# Altium schematic sheet esp32p10displaySheet1.SchDoc
size 381 x 241 mm; SheetNumber: 1; SheetTotal: 4
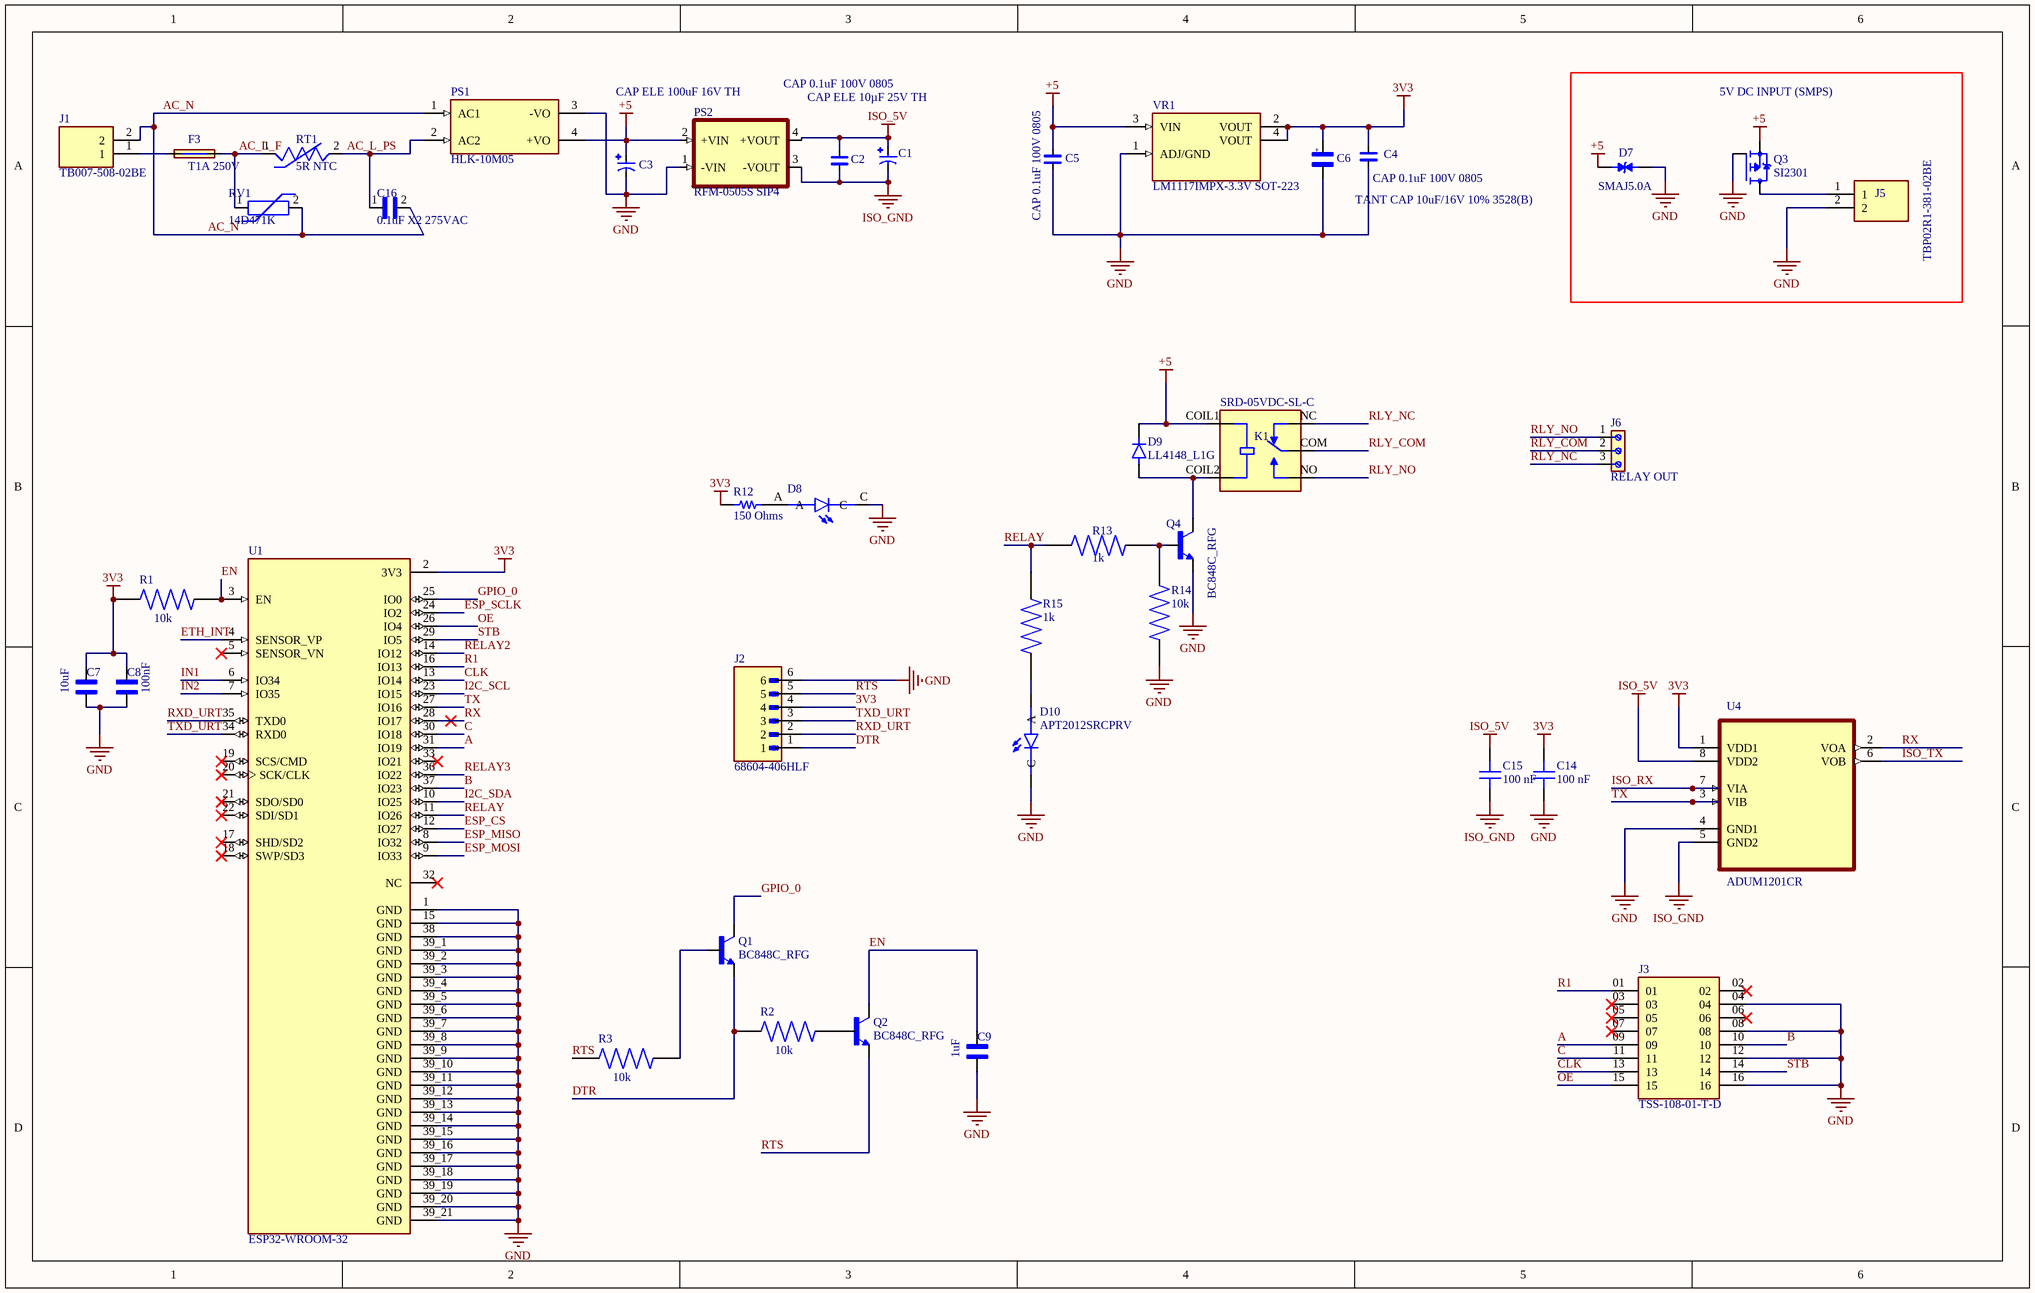
[diagram p0: esp32p10displaySheet1.SchDoc]

## Parts
C1  CAP ELE 10µF 25V TH  [CAP ELE 10µF 25V TH]
C2  CAP 0.1uF 100V 0805  [CAP CER 0.1uF/50V 5%]
C3  CAP ELE 100uF 16V TH  [CAP ELE 10µF 25V TH]
C4  CAP 0.1uF 100V 0805  [CAP CER 0.1uF/50V 5%]
C5  CAP 0.1uF 100V 0805  [CAP CER 0.1uF/50V 5%]
C6  TANT CAP 10uF/16V 10% 3528(B)  [TANT CAP 3528(B)]
C7  10uF  [CAPC3216X175N]
C8  100nF  [CAPC3216X175N]
C9  1uF  [CAPC3216X175N]
C14  Capacitance: 100 nF  [CAP 0805_2012]  (hidden comment: 100nF)
C15  Capacitance: 100 nF  [CAP 0805_2012]  (hidden comment: 100nF)
C16  0.1uF X2 275VAC  [CAPRR1500W60L1750T500H1200]
D7  SMAJ5.0A  [DIOM4325X250N]
D8  597-3305-607F  [LEDC2012X70N]  (value not drawn)
D9  LL4148_L1G  [DIOMELF3515N]
D10  APT2012SRCPRV  [LEDC2012X75N]
F3  T1A 250V  [TR5]
J1  TB007-508-02BE  [CUI_TB007-508-02BE]
J2  68604-406HLF  [AMPHENOL_68604-406HLF]
J3  TSS-108-01-T-D  [SAMTEC_TSS-108-01-T-D]
J5  TBP02R1-381-02BE  [CUI_TBP02R138102BE]
J6  RELAY OUT  [691236510003]
K1  SRD-05VDC-SL-C  [RELAY_SRD-03VDC-SL-C]
PS1  HLK-10M05  [CONV_HLK-10M05]
PS2  RFM-0505S SIP4  [RFM-0505S]
Q1  BC848C_RFG  [SOT95P237X112-3N]
Q2  BC848C_RFG  [SOT95P237X112-3N]
Q3  SI2301  [DESTO_SOT23]
Q4  BC848C_RFG  [SOT95P237X112-3N]
R1  10k  [RES_ERA6VRB1002V]
R2  10k  [RES_ERA6VRB1002V]
R3  10k  [RES_ERA6VRB1002V]
R12  150 Ohms  [RES 0805_2012]
R13  1k  [RES_ERA6VRB1002V]
R14  10k  [RES_ERA6VRB1002V]
R15  1k  [RES_ERA6VRB1002V]
RT1  5R NTC  [THRMRB500W60L1150T500H1600]
RV1  14D471K  [MOV14D471K]
U1  ESP32-WROOM-32  [MODULE_ESP32-WROOM-32]
U4  ADUM1201CR  [SOIC127P600X175-8N]
VR1  LM1117IMPX-3.3V SOT-223  [LM1117IMPX-3.3V SOT-223]

## Blocks framed on the sheet
5V DC INPUT (SMPS): D7 J5 Q3

## Nets
3V3: C4.2 C6.1 C7.1 C8.1 C14.2 J2.4 R1.1 R12.1 U1.2(3V3) U4.1(VDD1) VR1.2(VOUT) VR1.4(VOUT)
+5: C3.P C5.2 D7.C D9.C(K) K1.COIL1 PS1.4(+VO) PS2.2(+VIN) Q3.2(S) VR1.3(VIN)
GND: C3.N C4.1 C5.1 C6.2 C7.2 C8.2 C9.2 C14.1 D7.A D8.C D10.C J2.6 J3.04 J3.08 J3.12 J3.16 J5.2 PS1.3(-VO) PS2.1(-VIN) Q3.1(G) Q4.2(E) R14.1 U1.1(GND) U1.15(GND) U1.38(GND) U1.39_1(GND) U1.39_2(GND) U1.39_3(GND) U1.39_4(GND) U1.39_5(GND) U1.39_6(GND) U1.39_7(GND) U1.39_8(GND) U1.39_9(GND) U1.39_10(GND) U1.39_11(GND) U1.39_12(GND) U1.39_13(GND) U1.39_14(GND) U1.39_15(GND) U1.39_16(GND) U1.39_17(GND) U1.39_18(GND) U1.39_19(GND) U1.39_20(GND) U1.39_21(GND) U4.4(GND1) VR1.1(ADJ/GND)
ISO_5V: C1.P C2.2 C15.2 PS2.4(+VOUT) U4.8(VDD2)
ISO_GND: C1.N C2.1 C15.1 PS2.3(-VOUT) U4.5(GND2)
A: J3.09 U1.31(IO19)
AC_L_F: F3.2 RT1.1 RV1.1
AC_L_PS: C16.1 PS1.2(AC2) RT1.2
AC_N: C16.2 J1.2 PS1.1(AC1) RV1.2
B: J3.10 U1.37(IO23)
C: J3.11 U1.30(IO18)
CLK: J3.13 U1.13(IO14)
DTR: J2.1 Q1.2(E) R2.1
EN: C9.1 Q2.3(C) R1.2 U1.3(EN)
ESP_CS: U1.12(IO27)
ESP_MISO: U1.8(IO32)
ESP_MOSI: U1.9(IO33)
ESP_SCLK: U1.24(IO2)
ETH_INT: U1.4(SENSOR_VP)
GPIO_0: Q1.3(C) U1.25(IO0)
I2C_SCL: U1.23(IO15)
I2C_SDA: U1.10(IO25)
IN1: U1.6(IO34)
IN2: U1.7(IO35)
ISO_RX: U4.7(VIA)
ISO_TX: U4.6(VOB)
OE: J3.15 U1.26(IO4)
R1: J3.01 U1.16(IO13)
RELAY: R13.1 R15.2 U1.11(IO26)
RELAY2: U1.14(IO12)
RELAY3: U1.36(IO22)
RLY_COM: J6.2 K1.COM
RLY_NC: J6.3 K1.NC
RLY_NO: J6.1 K1.NO
RTS: J2.5 Q2.2(E) R3.1
RX: U1.28(IO17) U4.2(VOA)
RXD_URT: J2.2 U1.35(TXD0)
STB: J3.14 U1.29(IO5)
TX: U1.27(IO16) U4.3(VIB)
TXD_URT: J2.3 U1.34(RXD0)
NetD8_A: D8.A R12.2
NetD9_A: D9.A K1.COIL2 Q4.3(C)
NetD10_A: D10.A R15.1
NetF3_1: F3.1 J1.1
NetJ5_1: J5.1 Q3.3(D)
NetQ1_1: Q1.1(B) R3.2
NetQ2_1: Q2.1(B) R2.2
NetQ4_1: Q4.1(B) R13.2 R14.2

Not connected (* = marked no-connect by the designer): J3 02* 03* 05* 06* 07*; U1 5(SENSOR_VN)* 17(SHD/SD2)* 18(SWP/SD3)* 19(SCS/CMD)* 20(SCK/CLK)* 21(SDO/SD0)* 22(SDI/SD1)* 32(NC)* 33(IO21)*

## Notes on the sheet
- (in symbol TANT CAP 10uF/16V 5% 3528(B)) +

## Library data of the parts
C1 = CAP ELE 10µF 25V TH: 10µF 25V Aluminum Electrolytic Capacitors Radial Lead Type TH, Dia-5mm, Pitch-2mm ECEA1EN100UI; MF: Panasonic; Package: RADIAL-2 Panasonic; Purchase-URL: https://pricing.snapeda.com/search/part/ECEA1EN100UI/?ref=eda; Value: *; Digi-Key_Part_Number: ECE-A1EN100UI-ND; SnapEDA_Link: https://www.snapeda.com/parts/ECEA1EN100UI/Panasonic/view-part/5788532/?ref=snap; MP: ECEA1EN100UI; Check_prices: https://www.snapeda.com/parts/ECEA1EN100UI/Panasonic/view-part/5788532/?ref=eda
C2 = CAP CER 0.1uF/50V 5%: CAP CER 0.1uF/100V  Ceramic Capacitor X7R 0805 (2012 Metric); MF: Samsung; MP: CL21B104KCFNNNE; Purchase-URL: https://pricing.snapeda.com/search?q=CL21B104KCFNNNE&ref=eda; Package: 0805 Samsung; Check_prices: https://www.snapeda.com/parts/CL21B104KCFNNNE/Samsung+Electro-Mechanics/view-part/?ref=eda; Value: *; SnapEDA_Link: https://www.snapeda.com/parts/CL21B104KCFNNNE/Samsung+Electro-Mechanics/view-part/?ref=snap; Digi-Key_Part_Number: 1276-6840-2-ND
C3 = CAP ELE 10µF 25V TH: 100uF 16V Aluminum Electrolytic Capacitor Radial TH, Dia-5mm x 11mm (Panasonic M series); MP: ECA-1CM101; Package: RADIAL-2 Panasonic; MF: Panasonic; Value: *
C4 C5 = CAP CER 0.1uF/50V 5%: CAP CER 0.1uF/100V  Ceramic Capacitor X7R 0805 (2012 Metric) SMT; MF: Samsung; MP: CL21B104KCFNNNE; Purchase-URL: https://pricing.snapeda.com/search?q=CL21B104KCFNNNE&ref=eda; Package: 0805 Samsung; Check_prices: https://www.snapeda.com/parts/CL21B104KCFNNNE/Samsung+Electro-Mechanics/view-part/?ref=eda; Value: *; SnapEDA_Link: https://www.snapeda.com/parts/CL21B104KCFNNNE/Samsung+Electro-Mechanics/view-part/?ref=snap; Digi-Key_Part_Number: 1276-6840-2-ND
C6 = TANT CAP 10uF/16V 5% 3528(B): 10 µF Molded Tantalum Capacitor 16V 10% 1411 (3528 Metric), 1210 TAJB106K016RNJ; MF: AVX; SnapEDA_Link: https://www.snapeda.com/parts/TAJB106K016RNJ/AVX/view-part/?ref=snap; Package: 1210 AVX; Value: *; MP: TAJB106K016RNJ; Check_prices: https://www.snapeda.com/parts/TAJB106K016RNJ/AVX/view-part/?ref=eda
C7 = C1206C102KGRACAUTO: 10 µF ±10% 16V Ceramic Capacitor X7R 1206 (3216 Metric); MF: Murata; MP: GRM31CR71C106KAC7L; SnapEDA_Link: https://www.snapeda.com/search?q=GRM31CR71C106KAC7L&ref=snap; Package: 3216 KEMET; Value: *; Check_prices: https://www.snapeda.com/search?q=GRM31CR71C106KAC7L&ref=eda
C8 = C1206C102KGRACAUTO: 0.1 µF ±10% 50V Ceramic Capacitor X7R 1206 (3216 Metric); MF: KEMET; MP: C1206C104K5RACTU; SnapEDA_Link: https://www.snapeda.com/search?q=C1206C104K5RACTU&ref=snap; Package: 3216 KEMET; Value: *; Check_prices: https://www.snapeda.com/search?q=C1206C104K5RACTU&ref=eda
C9 = C1206C102KGRACAUTO: 1 µF ±10% 50V Ceramic Capacitor X7R 1206 (3216 Metric); MF: KEMET; MP: C1206C105K5RACTU; SnapEDA_Link: https://www.snapeda.com/search?q=C1206C105K5RACTU&ref=snap; Package: 3216 KEMET; Value: *; Check_prices: https://www.snapeda.com/search?q=C1206C105K5RACTU&ref=eda
C14 C15 = C0805C102F3HACAUTO: CAP CER 0805 0.1UF 100V X7R; Part Number: CL21B104KCFNNNE; manufacturer: Samsung Electro-Mechanics; Tolerance: ±10%; Applications: General Purpose; componentlink1description: Datasheet; componentlink1url: https://pricing.snapeda.com/search?q=CL21B104KCFNNNE&ref=eda; componentlink2description: DigiKey Link; componentlink2url: https://www.digikey.com/en/products/result?keywords=CL21B104KCFNNNE; Device Package: 0805 (2012 Metric); lastupdated: 09-02-2024 8.15.10 PM; Lifecycle Status: Active; Minimum Order: 1; Mounting Type: Surface Mount, MLCC; Operating Temperature: -55°C ~ 125°C; Package / Case: 0805 (2012 Metric); packaging: TapeAndReel; Part Status: Active; series: CL; Size / Dimension: 0.079" L x 0.049" W (2.00mm x 1.25mm); Supplier 1: DigiKey; Temperature Coefficient: X7R; Thickness (Max): 0.85mm; value: 100 nF; Voltage - Rated: 100V
C16 = ECQUAAF104M: Film Capacitor X2 0.1uF 275VAC 15mm pitch; Availability: Unavailable; Price: None; MP: ECQUAAF104M; Package: None; Value: *
D7 = SMAJ7.5CA: TVS diode unidirectional 5V standoff 400W SMA (DO-214AC); pin 1 = cathode; Availability: Unavailable; Package: None; MP: SMAJ5.0A; Value: *; Price: None
D8 = 597-3305-607F: LED Uni-Color Green 4-Pin Chip 0805 T/R; Availability: Unavailable; Value: *; Price: None; MP: 597-3305-607F; Package: None
D10 = APT2012SRCPRV: Red 640nm LED Indication - Discrete 1.85V 0805 (2012 Metric); MF: Kingbright; SnapEDA_Link: https://www.snapeda.com/parts/APT2012SRCPRV/Kingbright/view-part/?ref=snap; Package: 0805 Kingbright; Value: *; MP: APT2012SRCPRV; Check_prices: https://www.snapeda.com/parts/APT2012SRCPRV/Kingbright/view-part/?ref=eda
F3 = TR5: Fuse TR5 1A Time-Lag 250VAC (Littelfuse 372 series); MF: Taiyo Yuden; SnapEDA_Link: https://www.snapeda.com/parts/TR5/Taiyo+Yuden/view-part/?ref=snap; Package: None; Value: *; MP: TR5; Check_prices: https://www.snapeda.com/parts/TR5/Taiyo+Yuden/view-part/?ref=eda
J1 = TB007-508-02BE: 2~24 Poles, Screw Type, Horizontal, 5.08 Pitch, 24~12 (AWG), Terminal Block Connector; MF: Same Sky; SnapEDA_Link: https://www.snapeda.com/parts/TB007-508-02BE/Same+Sky/view-part/?ref=snap; Package: None; Value: *; MP: TB007-508-02BE; Check_prices: https://www.snapeda.com/parts/TB007-508-02BE/Same+Sky/view-part/?ref=eda
J2 = 68604-406HLF: BergStik, Board to Board connector, Unshrouded Vertical Header, Through Hole, Single Row, 6 Positions, 2.54 mm (0.100in) Pitch.; MF: AMPHENOL ICC / FCI; SnapEDA_Link: https://www.snapeda.com/parts/68604-406HLF/Amphenol/view-part/?ref=snap; Package: None; Value: *; MP: 68604-406HLF; Check_prices: https://www.snapeda.com/parts/68604-406HLF/Amphenol/view-part/?ref=eda
J5 = TBP02R138102BE: Terminal block header 2-pos 3.81 mm, right angle (mating plug TBP01P1-381-02BE); MF: Same Sky (CUI); SnapEDA_Link: https://www.snapeda.com/parts/TBP02R1-381-02BE/Same+Sky/view-part/?ref=snap; Package: None; Value: *; MP: TBP02R1-381-02BE; Check_prices: https://www.snapeda.com/parts/TBP02R1-381-02BE/Same+Sky/view-part/?ref=eda
J6 = 691236510003: 3 Position Wire to Board Terminal Block Horizontal with Board 0.200 (5.08mm) Through Hole; MF: WÃ¼rth Elektronik; SnapEDA_Link: https://www.snapeda.com/parts/691236510003/W%25C3%25BCrth+Elektronik+Midcom/view-part/?ref=snap; Package: None; Value: *; MP: 691236510003; Check_prices: https://www.snapeda.com/parts/691236510003/W%25C3%25BCrth+Elektronik+Midcom/view-part/?ref=eda
K1 = SRD-03VDC-SL-C: Relays General Purpose Non Latching 3VDC SPDT 10A (250VAC) Max 5PIN; Manufacturer: Songle; MF: Songle Relay; SnapEDA_Link: https://www.snapeda.com/parts/SRD-03VDC-SL-C/Songle+Relay/view-part/?ref=snap; Package: NON STANDARD-5 Songle Relay; Value: *; MP: SRD-05VDC-SL-C; Check_prices: https://www.snapeda.com/parts/SRD-03VDC-SL-C/Songle+Relay/view-part/?ref=eda
PS1 = HLK-10M05: 10W Ultra-Compact Power Module; MF: Hi-link; SnapEDA_Link: https://www.snapeda.com/parts/HLK-10M05/Hi-link/view-part/?ref=snap; Package: Package; Value: *; MP: HLK-10M05; Check_prices: https://www.snapeda.com/parts/HLK-10M05/Hi-link/view-part/?ref=eda
PS2 = RFM-0505S: DC-DC Converter/Isolator, SIP4, 1kV unreg, Single Output, 1W, 5V Out, RFM Series | RECOM Power Inc. RFM-0505S; SnapEDA_Link: https://www.snapeda.com/parts/RFM-0505S/Recom+Power/view-part/?ref=snap; Package: SIP-4 Recom Power; Value: *; MF: Recom Power; MP: RFM-0505S; Check_prices: https://www.snapeda.com/parts/RFM-0505S/Recom+Power/view-part/?ref=eda
Q1 Q2 Q4 = BC848C_RFG: SOT-23, 30V, 0.1A, NPN Transistor; MF: Taiwan Semiconductor; MP: BC848C RFG; SnapEDA_Link: https://www.snapeda.com/parts/BC848C%20RFG/Taiwan+Semiconductor/view-part/?ref=snap; Package: SOT-23 Taiwan Semiconductor; Value: *; Check_prices: https://www.snapeda.com/parts/BC848C%20RFG/Taiwan+Semiconductor/view-part/?ref=eda
Q3 = SI2301: P-MOSFET 20V 2.3A SOT-23, reverse-polarity protection for 5V DC input; MF: Vishay; MP: SI2301CDS-T1-GE3; SnapEDA_Link: https://www.snapeda.com/parts/SI2301/Micro+Commercial+Components/view-part/?ref=snap; Package: SOT-23 MCC; Value: *; Check_prices: https://www.snapeda.com/parts/SI2301/Micro+Commercial+Components/view-part/?ref=eda
R1-R3 R14 = ERA6VRB1002V: Availability: Unavailable; Package: None; MP: ERA6VRB1002V; Value: *; Price: None
R12 = CRCW0805330RFKEAHP: RES SMD 150 OHM 1% 1/2W 0805; Part Number: CRCW0805150RFKEAHP; Manufacturer: Vishay Dale; Power (Watts): 0.5W, 1/2W; Temperature Coefficient: ±100ppm/°C; Value: 150 Ohms; ComponentLink1Description: Datasheet; ComponentLink1URL: http://www.vishay.com/docs/20043/crcwhpe3.pdf; ComponentLink2Description: DigiKey Link; ComponentLink2URL: https://www.digikey.com/en/products/detail/vishay-dale/CRCW0805150RFKEAHP/2222332; Composition: Thick Film; Device Package: 0805 (2012 Metric); Features: Automotive AEC-Q200, Pulse Withstanding; Height - Seated (Max): 0.020" (0.50mm); LastUpdated: 08-02-2024 9.02.28 PM; Lifecycle Status: Active; Minimum Order: 1; Number of Terminations: 2; Operating Temperature: -55°C ~ 155°C; Package / Case: 0805 (2012 Metric); Packaging: TapeAndReel; PartId: 30364; Part Status: Active; Price: 0.02; Ratings: AEC-Q200; Resistance: 150 Ohms; Series: CRCW-HP; Size / Dimension: 0.079" L x 0.049" W (2.00mm x 1.25mm); Supplier 1: DigiKey; Supplier Part Number 1: 541-150TCT-ND; Supplier Device Package: 0805; Tolerance: ±1%
R13 R15 = ERA6VRB1002V: MP: ERA6VRB1001V; Availability: Unavailable; Package: None; Value: *; Price: None
RT1 = B57236S0509M000: NTC Inrush Current Limiter 5 Ohm 20% 4.5A 11.5mm; MF: EPCOS - TDK Electronics; SnapEDA_Link: https://www.snapeda.com/parts/B57236S0509M000/TDK/view-part/?ref=snap; Package: None; Value: *; MP: B57236S0509M000; Check_prices: https://www.snapeda.com/parts/B57236S0509M000/TDK/view-part/?ref=eda
RV1 = MOV-14D471K: Varistor 14mm 470V (300VAC); MF: HuaXingAn Electronics; SnapEDA_Link: https://www.snapeda.com/parts/MOV-14D471K/HuaXingAn+Electronics/view-part/?ref=snap; Package: None; Value: *; MP: MOV-14D471K; Check_prices: https://www.snapeda.com/parts/MOV-14D471K/HuaXingAn+Electronics/view-part/?ref=eda
U1 = ESP32-WROOM-32: Bluetooth, WiFi 802.11b/g/n, Bluetooth v4.2 +EDR, Class 1, 2 and 3 Transceiver Module 2.4GHz ~ 2.5GHz Antenna Not Included, U.FL Surface Mount; MF: Espressif Systems; Price: None; Availability: In Stock; MP: ESP32-WROOM-32; Package: Module Espressif Systems; SnapEDA_Link: https://www.snapeda.com/parts/ESP32-WROOM-32/Espressif+Systems/view-part/?ref=snap; Check_prices: https://www.snapeda.com/parts/ESP32-WROOM-32/Espressif+Systems/view-part/?ref=eda; Value: *; Purchase-URL: https://pricing.snapeda.com/search/part/ESP32-WROOM-32/?ref=eda
U4 = ADUM1201CR: General Purpose Digital Isolator 2500Vrms 2 Channel 25Mbps 8-SOIC; MF: Analog Devices; SnapEDA_Link: https://www.snapeda.com/parts/ADUM1201CR/Analog+Devices/view-part/?ref=snap; Package: SOIC-8 Analog Devices; Value: *; MP: ADUM1201CR; Check_prices: https://www.snapeda.com/parts/ADUM1201CR/Analog+Devices/view-part/?ref=eda
VR1 = LM1117IMPX-3.3V SOT-223: LM1117IMPX-3.3V 800-mA 15-V linear voltage regulator SOT-223; MF: Texas Instruments; MP: LM1117IMPX-3.3/NOPB; SnapEDA_Link: https://www.snapeda.com/parts/LM1117IMPX-3.3/NOPB/Texas+Instruments/view-part/?ref=snap; Package: SOT-223-4 Texas Instruments; Value: *; Check_prices: https://www.snapeda.com/parts/LM1117IMPX-3.3/NOPB/Texas+Instruments/view-part/?ref=eda
D9 = LL4148_L1G: MP: LL4148_L1G; Price: None; Package: None; Availability: Unavailable; Value: *
J3 = TSS-108-01-T-D: Availability: Unavailable; MP: TSS-108-01-T-D; Value: *; Price: None; Package: None